# Altium schematic sheet Opto_Section.SchDoc
size A4; DocumentNumber: 5; SheetNumber: 5; SheetTotal: 6
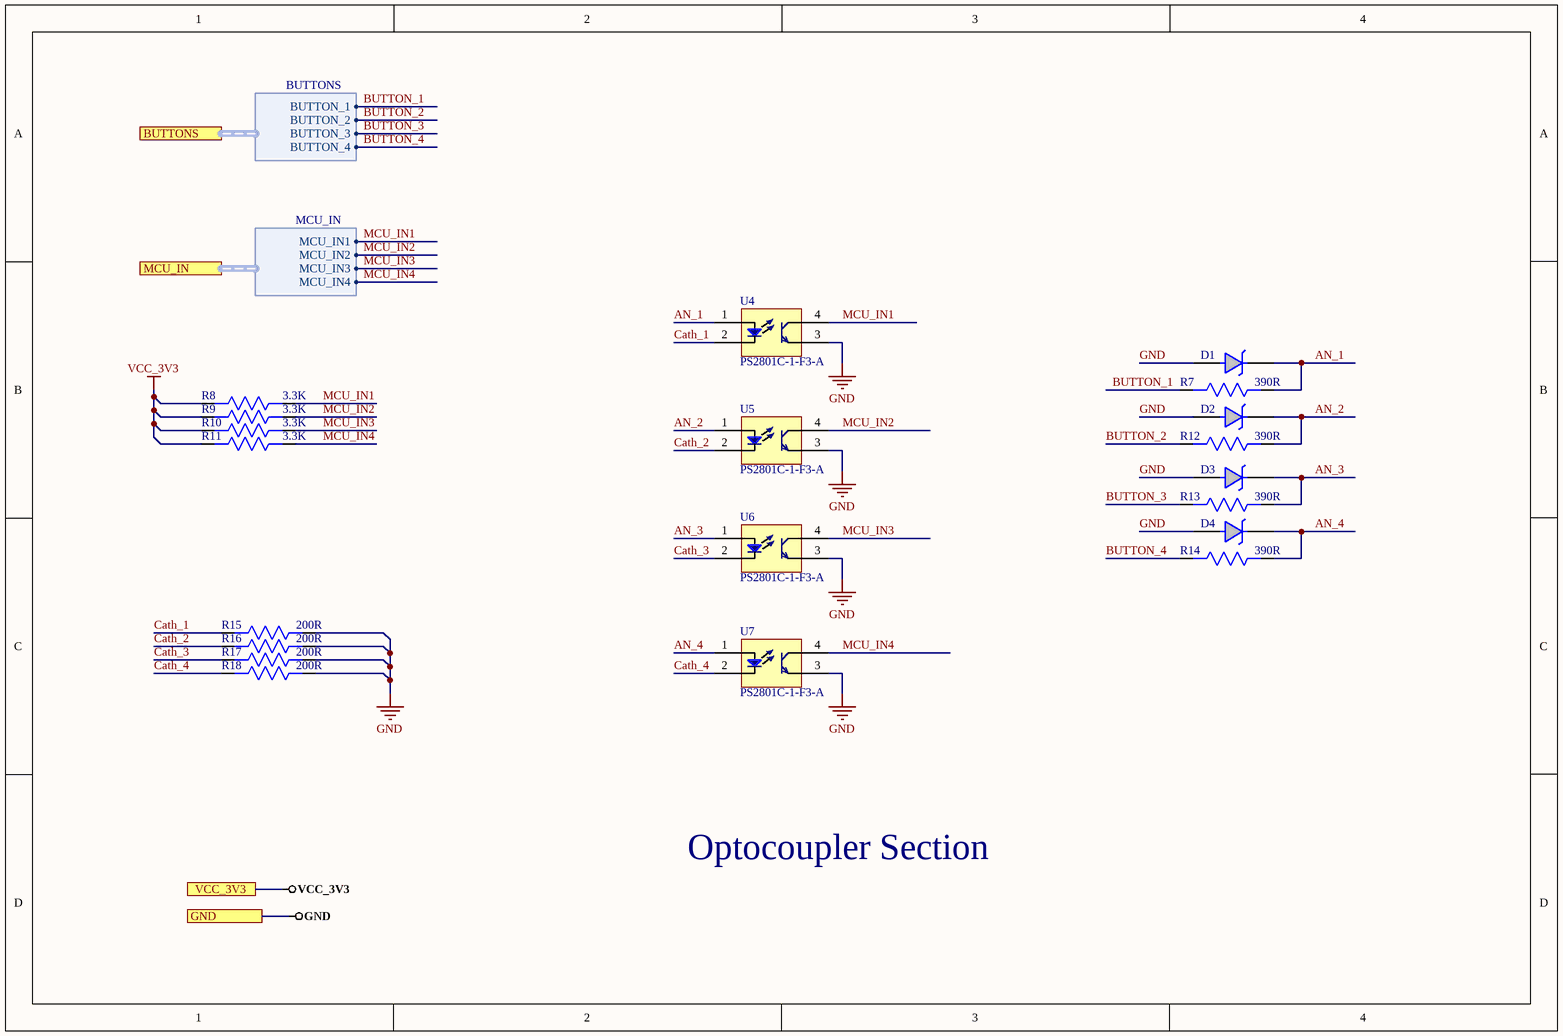
[diagram p0: Opto_Section.SchDoc]

## Parts
D1  MM3Z3V3B  [MM3Z3V3B]  (value not drawn)
D2  MM3Z3V3B  [MM3Z3V3B]  (value not drawn)
D3  MM3Z3V3B  [MM3Z3V3B]  (value not drawn)
D4  MM3Z3V3B  [MM3Z3V3B]  (value not drawn)
R7  390R  [RES 2512]
R8  3.3K  [Res0603]
R9  3.3K  [Res0603]
R10  3.3K  [Res0603]
R11  3.3K  [Res0603]
R12  390R  [RES 2512]
R13  390R  [RES 2512]
R14  390R  [RES 2512]
R15  200R  [Res0603]
R16  200R  [Res0603]
R17  200R  [Res0603]
R18  200R  [Res0603]
U4  PS2801C-1-F3-A  [PS2801C-1-F3-A]
U5  PS2801C-1-F3-A  [PS2801C-1-F3-A]
U6  PS2801C-1-F3-A  [PS2801C-1-F3-A]
U7  PS2801C-1-F3-A  [PS2801C-1-F3-A]

## Ports
BUTTONS (harness BUTTONS), GND, MCU_IN (harness MCU_IN), VCC_3V3

## Harnesses
MCU_IN: MCU_IN1, MCU_IN2, MCU_IN3, MCU_IN4
BUTTONS: BUTTON_1, BUTTON_2, BUTTON_3, BUTTON_4

## Nets
GND: D1.1(ANODE) D2.1(ANODE) D3.1(ANODE) D4.1(ANODE) R15.1 R16.1 R17.1 R18.1 U4.3(E) U5.3(E) U6.3(E) U7.3(E) ; port GND
VCC_3V3: R8.2 R9.2 R10.2 R11.2 ; port VCC_3V3
AN_1: D1.2(CATHODE) R7.1 U4.1(An)
AN_2: D2.2(CATHODE) R12.1 U5.1(An)
AN_3: D3.2(CATHODE) R13.1 U6.1(An)
AN_4: D4.2(CATHODE) R14.1 U7.1(An)
BUTTON_1: R7.2 ; port BUTTONS.BUTTON_1
BUTTON_2: R12.2 ; port BUTTONS.BUTTON_2
BUTTON_3: R13.2 ; port BUTTONS.BUTTON_3
BUTTON_4: R14.2 ; port BUTTONS.BUTTON_4
Cath_1: R15.2 U4.2(Ca)
Cath_2: R16.2 U5.2(Ca)
Cath_3: R17.2 U6.2(Ca)
Cath_4: R18.2 U7.2(Ca)
MCU_IN1: R8.1 U4.4(C) ; port MCU_IN.MCU_IN1
MCU_IN2: R9.1 U5.4(C) ; port MCU_IN.MCU_IN2
MCU_IN3: R10.1 U6.4(C) ; port MCU_IN.MCU_IN3
MCU_IN4: R11.1 U7.4(C) ; port MCU_IN.MCU_IN4

## Notes on the sheet
- Optocoupler Section

## Library data of the parts
D1-D4 = MM3Z3V3B: DIODE ZENER 3.3V 200MW SOD323F; Manufacturer: ON Semiconductor / Fairchild; Forward Voltage: 1V; Tolerance: 2%; Impedance: 89R; Max Reverse Leakage Current: 4.5uA; Test Current: 5mA; Element Configuration: Single; Supplier 1: Digi-Key; Manufacturer Part Number: MM3Z3V3B; Stock 1: 473644; Pricing 1: 1=0.22, 10=0.18, 100=0.0956, 500=0.06288, 1000=0.04276 (USD); Mount: Surface Mount; Number of Pins: 2; Weight: 0.0276g; Min Operating Temperature: -65°C; Max Operating Temperature: 150°C; Packaging: Tape and Reel; Package Quantity: 1; Max Power Dissipation: 200mW; Zener Voltage: 3.3V; Voltage Tolerance: 2%; Power Dissipation: 200mW; Working Voltage: 3.3V; Peak Reverse Current: 4.5uA; Length: 1.3mm; Height: 1mm; Width: 1.7mm; Radiation Hardening: No; REACH SVHC: No SVHC; Lead Free: Lead Free; ComponentLink1URL: http://www.onsemi.com/pub/Collateral/MM3Z9V1B-D.pdf?src-supplier=Digi-Key; ComponentLink1Description: http://www.onsemi.com/pub/Collateral/MM3Z9V1B-D.pdf?src-supplier=Digi-Key; ComponentLink2URL: http://www.mouser.com/ds/2/149/MM3Z3V3B-187166.pdf?src-supplier=Mouser; ComponentLink2Description: http://www.mouser.com/ds/2/149/MM3Z3V3B-187166.pdf?src-supplier=Mouser; ComponentLink3URL: https://www.fairchildsemi.com/datasheets/MM/MM3Z9V1B.pdf?src-supplier=Avnet; ComponentLink3Description: https://www.fairchildsemi.com/datasheets/MM/MM3Z9V1B.pdf?src-supplier=Avnet; ComponentLink4URL: http://www.farnell.com/datasheets/1706525.pdf?src-supplier=Element14; ComponentLink4Description: http://www.farnell.com/datasheets/1706525.pdf?src-supplier=Element14; Supplier Part Number 1: MM3Z3V3BCT-ND
R7 R12-R14 = 25121WF3900T4E: Resistors 200V 390Ω 2512 Chip Resistor SMD; Manufacturer: UNI-ROYAL; Manufacturer Part No: 25121WF3900T4E; Package: 2512; Value: 390Ω; ComponentLink1Description: LCSC; ComponentLink1URL: https://lcsc.com/product-detail/Chip-span-style-background-color-ff0-Resistor-span-Surface-Mount_UNI-ROYAL-Uniroyal-Elec-25121WF3900T4E_C60131.html
R8-R11 = RC0603FR-073K3L: RES SMD 3.3K OHM 1% 1/10W 0603; Manufacturer: Yageo Phycomp; Temperature Coefficient: 100ppm/°C; Resistance: 3.3kR; Voltage Rating (DC): 50V; Power Rating: 100mW; Supplier 1: Digi-Key; Manufacturer Part Number: RC0603FR-073K3L; Stock 1: 6863000; Pricing 1: 1=0.1, 10=0.024, 100=0.0097, 1000=0.00437, 2500=0.00379 (USD); Mount: Surface Mount; Case/Package: 0603; Number of Pins: 2; Min Operating Temperature: -55°C; Max Operating Temperature: 155°C; Tolerance: 1%; Packaging: Cut Tape; Length: 1.6mm; Height: 0.45mm; Width: 800um; Depth: 0.8mm; REACH SVHC: No SVHC; Lead Free: Lead Free; Supplier Part Number 1: 311-3.30KHRCT-ND
R15-R18 = RT0603DRD07200RL: RES SMD 200 OHM 0.5% 1/10W 0603; Manufacturer: Yageo; Power Rating: 100mW; Voltage Rating (DC): 50V; Supplier 1: Digi-Key; Manufacturer Part Number: RT0603DRD07200RL; Stock 1: 19572; Pricing 1: 1=0.21, 10=0.174, 100=0.0682, 1000=0.02855, 2500=0.02617 (USD); Case/Package: 0603; Resistance: 200R; Tolerance: 0.5%; Packaging: Cut Tape; Lead Free: Lead Free; Supplier Part Number 1: 311-200DCT-ND
U4-U7 = PS2801C-1-F3-A: TransistorOptocouplers DC 1 2500Vrms SOP-4_P1.27 Optocouplers RoHS; Manufacturer: CEL; Number of Channels: 1; Collector Emitter Voltage (VCEO): 300mV; Forward Voltage: 1.2V; Max Power Dissipation: 120mW; Max Collector Current: 30mA; Max Output Voltage: 80V; Supplier 1: Digi-Key; Manufacturer Part Number: PS2801C-1-F3-A; Stock 1: 399; Pricing 1: 1=0.77, 10=0.595, 100=0.3825 (USD); Mount: Surface Mount; Case/Package: SOIC; Number of Pins: 4; Min Operating Temperature: -55°C; Max Operating Temperature: 100°C; Packaging: Tape and Reel; Collector Emitter Saturation Voltage: 300mV; Package Quantity: 1; Output Current per Channel: 30mA; Lead Free: Lead Free; ComponentLink1URL: http://www.cel.com/pdf/datasheets/PS2801C-1,PS2801C-4.pdf?src-supplier=Digi-Key; ComponentLink1Description: http://www.cel.com/pdf/datasheets/PS2801C-1,PS2801C-4.pdf?src-supplier=Digi-Key; ComponentLink2URL: http://www.cel.com/pdf/datasheets/how_to_order_optos.pdf?src-supplier=Digi-Key; ComponentLink2Description: http://www.cel.com/pdf/datasheets/how_to_order_optos.pdf?src-supplier=Digi-Key; ComponentLink3URL: http://datasheet.iiic.cc/cel/PS2801C-1-F3-A.pdf?src-supplier=IIIC; ComponentLink3Description: http://datasheet.iiic.cc/cel/PS2801C-1-F3-A.pdf?src-supplier=IIIC; Supplier Part Number 1: PS2801C-1-F3-ACT-ND